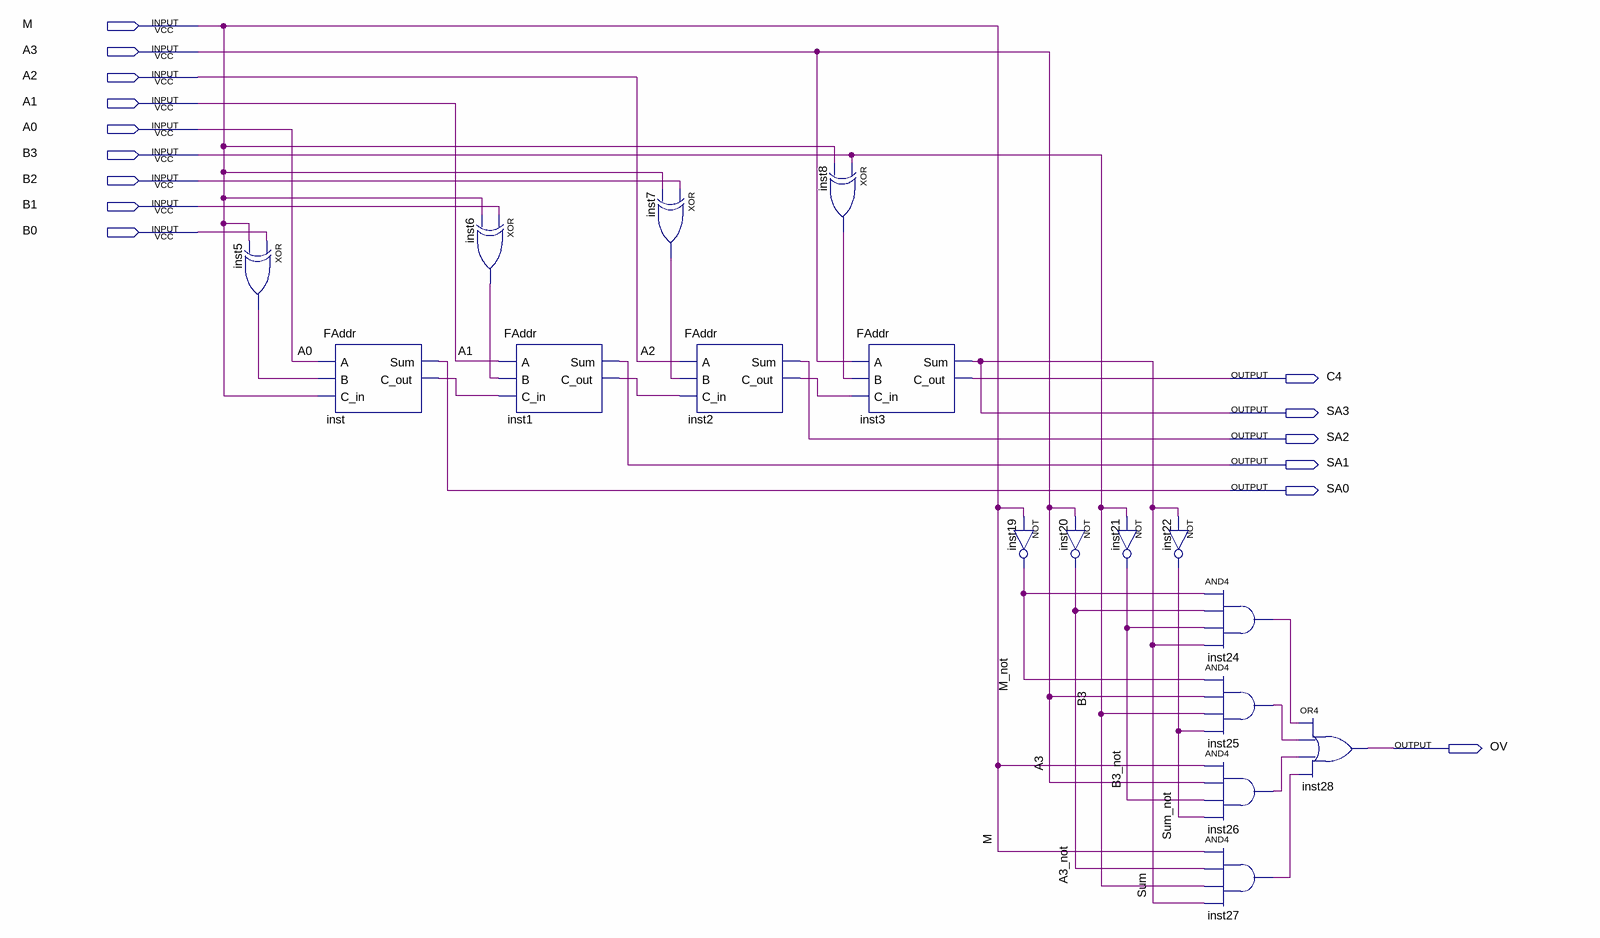
[diagram p0: schematic sheet]
// Quartus schematic FourBitAdder.bdf as structural Verilog: 17 symbols, 15 pins
module FourBitAdder (
  input  M,
  input  A3,
  input  A2,
  input  A1,
  input  A0,
  input  B3,
  input  B2,
  input  B1,
  input  B0,
  output C4,
  output SA3,
  output SA2,
  output SA1,
  output SA0,
  output OV
);

  wire A3_not, B3_not, inst1_c_out, inst2_c_out, inst5_out, inst6_out, inst7_out, inst8_out, inst24_out,
       inst25_out, inst26_out, inst27_out, inst_c_out, M_not, Sum_not;

  xor inst5 (inst5_out, B0, M);
  FAddr inst (.A(A0), .B(inst5_out), .C_in(M), .Sum(SA0), .C_out(inst_c_out));
  xor inst6 (inst6_out, B1, M);
  FAddr inst1 (.A(A1), .B(inst6_out), .C_in(inst_c_out), .Sum(SA1), .C_out(inst1_c_out));
  xor inst7 (inst7_out, B2, M);
  FAddr inst2 (.A(A2), .B(inst7_out), .C_in(inst1_c_out), .Sum(SA2), .C_out(inst2_c_out));
  xor inst8 (inst8_out, B3, M);
  FAddr inst3 (.A(A3), .B(inst8_out), .C_in(inst2_c_out), .Sum(SA3), .C_out(C4));
  not inst19 (M_not, M);
  not inst20 (A3_not, A3);
  not inst21 (B3_not, B3);
  not inst22 (Sum_not, SA3);
  and inst24 (inst24_out, M_not, A3_not, B3_not, SA3);
  and inst25 (inst25_out, M_not, A3, B3, Sum_not);
  and inst26 (inst26_out, M, A3, B3_not, Sum_not);
  and inst27 (inst27_out, M, A3_not, B3, SA3);
  or inst28 (OV, inst24_out, inst25_out, inst26_out, inst27_out);

  // Other names for the same wires on the sheet: Sum = SA3
endmodule
